# Altium schematic sheet PCB4_Top.SchDoc: CubeSat UD34 - PCB 4: Carga Útil y ADCS (Hoja Superior)
size A4; Author: Jesús Mendoza / Andrés Agudelo - Universidad de Antioquia; Revision: 1.0; SheetNumber: 1; SheetTotal: 5
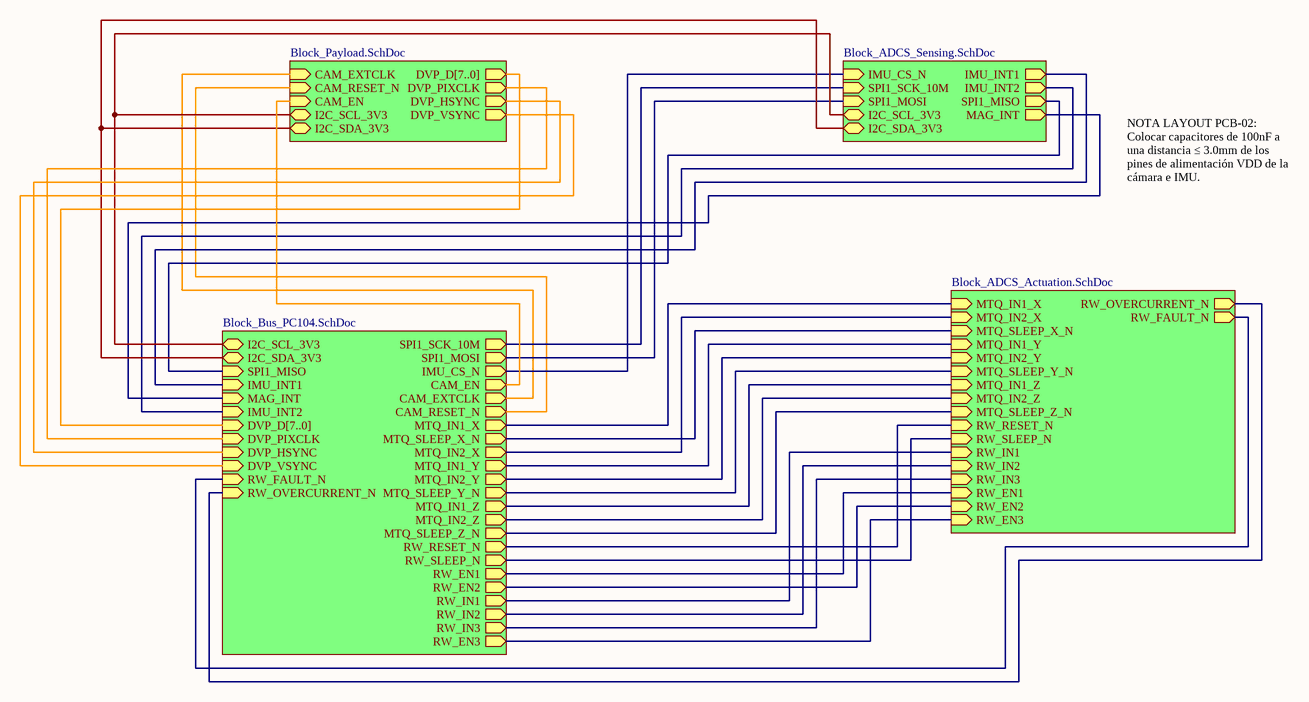
[diagram p0: PCB4_Top.SchDoc]

## Sub-sheets
? = Block_Payload.SchDoc: CAM_EXTCLK (in), CAM_RESET_N (in), DVP_D[7..0] (out), CAM_EN (in), I2C_SCL_3V3 (bidir), I2C_SDA_3V3 (bidir), DVP_PIXCLK (out), DVP_HSYNC (out), DVP_VSYNC (out)
? = Block_ADCS_Actuation.SchDoc: MTQ_IN1_X (in), MTQ_IN2_X (in), MTQ_SLEEP_X_N (in), MTQ_IN1_Y (in), MTQ_IN2_Y (in), MTQ_SLEEP_Y_N (in), MTQ_IN1_Z (in), MTQ_IN2_Z (in), MTQ_SLEEP_Z_N (in), RW_OVERCURRENT_N (out), RW_RESET_N (in), RW_SLEEP_N (in), RW_FAULT_N (out), RW_IN1 (in), RW_IN2 (in), RW_IN3 (in), RW_EN1 (in), RW_EN2 (in), RW_EN3 (in)
? = Block_ADCS_Sensing.SchDoc: IMU_INT1 (out), IMU_INT2 (out), IMU_CS_N (in), SPI1_SCK_10M (in), SPI1_MOSI (in), SPI1_MISO (out), MAG_INT (out), I2C_SCL_3V3 (bidir), I2C_SDA_3V3 (bidir)
? = Block_Bus_PC104.SchDoc: I2C_SCL_3V3 (bidir), I2C_SDA_3V3 (bidir), SPI1_SCK_10M (out), SPI1_MOSI (out), SPI1_MISO (in), IMU_CS_N (out), IMU_INT1 (in), MAG_INT (in), IMU_INT2 (in), CAM_EN (out), CAM_EXTCLK (out), CAM_RESET_N (out), DVP_D[7..0] (in), DVP_PIXCLK (in), DVP_HSYNC (in), DVP_VSYNC (in), MTQ_IN1_X (out), MTQ_SLEEP_X_N (out), MTQ_IN2_X (out), MTQ_IN1_Y (out), MTQ_IN2_Y (out), MTQ_SLEEP_Y_N (out), MTQ_IN1_Z (out), MTQ_IN2_Z (out), MTQ_SLEEP_Z_N (out), RW_RESET_N (out), RW_SLEEP_N (out), RW_EN1 (out), RW_EN2 (out), RW_IN1 (out), RW_IN2 (out), RW_IN3 (out), RW_EN3 (out), RW_FAULT_N (in), RW_OVERCURRENT_N (in)

## Nets
(unnamed): sheet /CAM_EXTCLK, sheet /CAM_EXTCLK
(unnamed): sheet /CAM_RESET_N, sheet /CAM_RESET_N
(unnamed): sheet /CAM_EN, sheet /CAM_EN
(unnamed): sheet /I2C_SCL_3V3, sheet /I2C_SCL_3V3, sheet /I2C_SCL_3V3
(unnamed): sheet /I2C_SDA_3V3, sheet /I2C_SDA_3V3, sheet /I2C_SDA_3V3
(unnamed): sheet /DVP_PIXCLK, sheet /DVP_PIXCLK
(unnamed): sheet /DVP_HSYNC, sheet /DVP_HSYNC
(unnamed): sheet /DVP_VSYNC, sheet /DVP_VSYNC
(unnamed): sheet /MTQ_IN1_X, sheet /MTQ_IN1_X
(unnamed): sheet /MTQ_IN2_X, sheet /MTQ_IN2_X
(unnamed): sheet /MTQ_SLEEP_X_N, sheet /MTQ_SLEEP_X_N
(unnamed): sheet /MTQ_IN1_Y, sheet /MTQ_IN1_Y
(unnamed): sheet /MTQ_IN2_Y, sheet /MTQ_IN2_Y
(unnamed): sheet /MTQ_SLEEP_Y_N, sheet /MTQ_SLEEP_Y_N
(unnamed): sheet /MTQ_IN1_Z, sheet /MTQ_IN1_Z
(unnamed): sheet /MTQ_IN2_Z, sheet /MTQ_IN2_Z
(unnamed): sheet /MTQ_SLEEP_Z_N, sheet /MTQ_SLEEP_Z_N
(unnamed): sheet /RW_OVERCURRENT_N, sheet /RW_OVERCURRENT_N
(unnamed): sheet /RW_RESET_N, sheet /RW_RESET_N
(unnamed): sheet /RW_SLEEP_N, sheet /RW_SLEEP_N
(unnamed): sheet /RW_FAULT_N, sheet /RW_FAULT_N
(unnamed): sheet /RW_IN1, sheet /RW_IN1
(unnamed): sheet /RW_IN2, sheet /RW_IN2
(unnamed): sheet /RW_IN3, sheet /RW_IN3
(unnamed): sheet /RW_EN1, sheet /RW_EN1
(unnamed): sheet /RW_EN2, sheet /RW_EN2
(unnamed): sheet /RW_EN3, sheet /RW_EN3
(unnamed): sheet /IMU_INT1, sheet /IMU_INT1
(unnamed): sheet /IMU_INT2, sheet /IMU_INT2
(unnamed): sheet /IMU_CS_N, sheet /IMU_CS_N
(unnamed): sheet /SPI1_SCK_10M, sheet /SPI1_SCK_10M
(unnamed): sheet /SPI1_MOSI, sheet /SPI1_MOSI
(unnamed): sheet /SPI1_MISO, sheet /SPI1_MISO
(unnamed): sheet /MAG_INT, sheet /MAG_INT

## Notes on the sheet
- NOTA LAYOUT PCB-02: Colocar capacitores de 100nF a una distancia ≤ 3.0mm de los pines de alimentación VDD de la cámara e IMU.